# Altium project Smart Meter V1.0.PrjPcb (part 2 of 4)

## Sheet Controller Sheet.SchDoc
size 420 x 297 mm; SheetNumber: 2; SheetTotal: 6
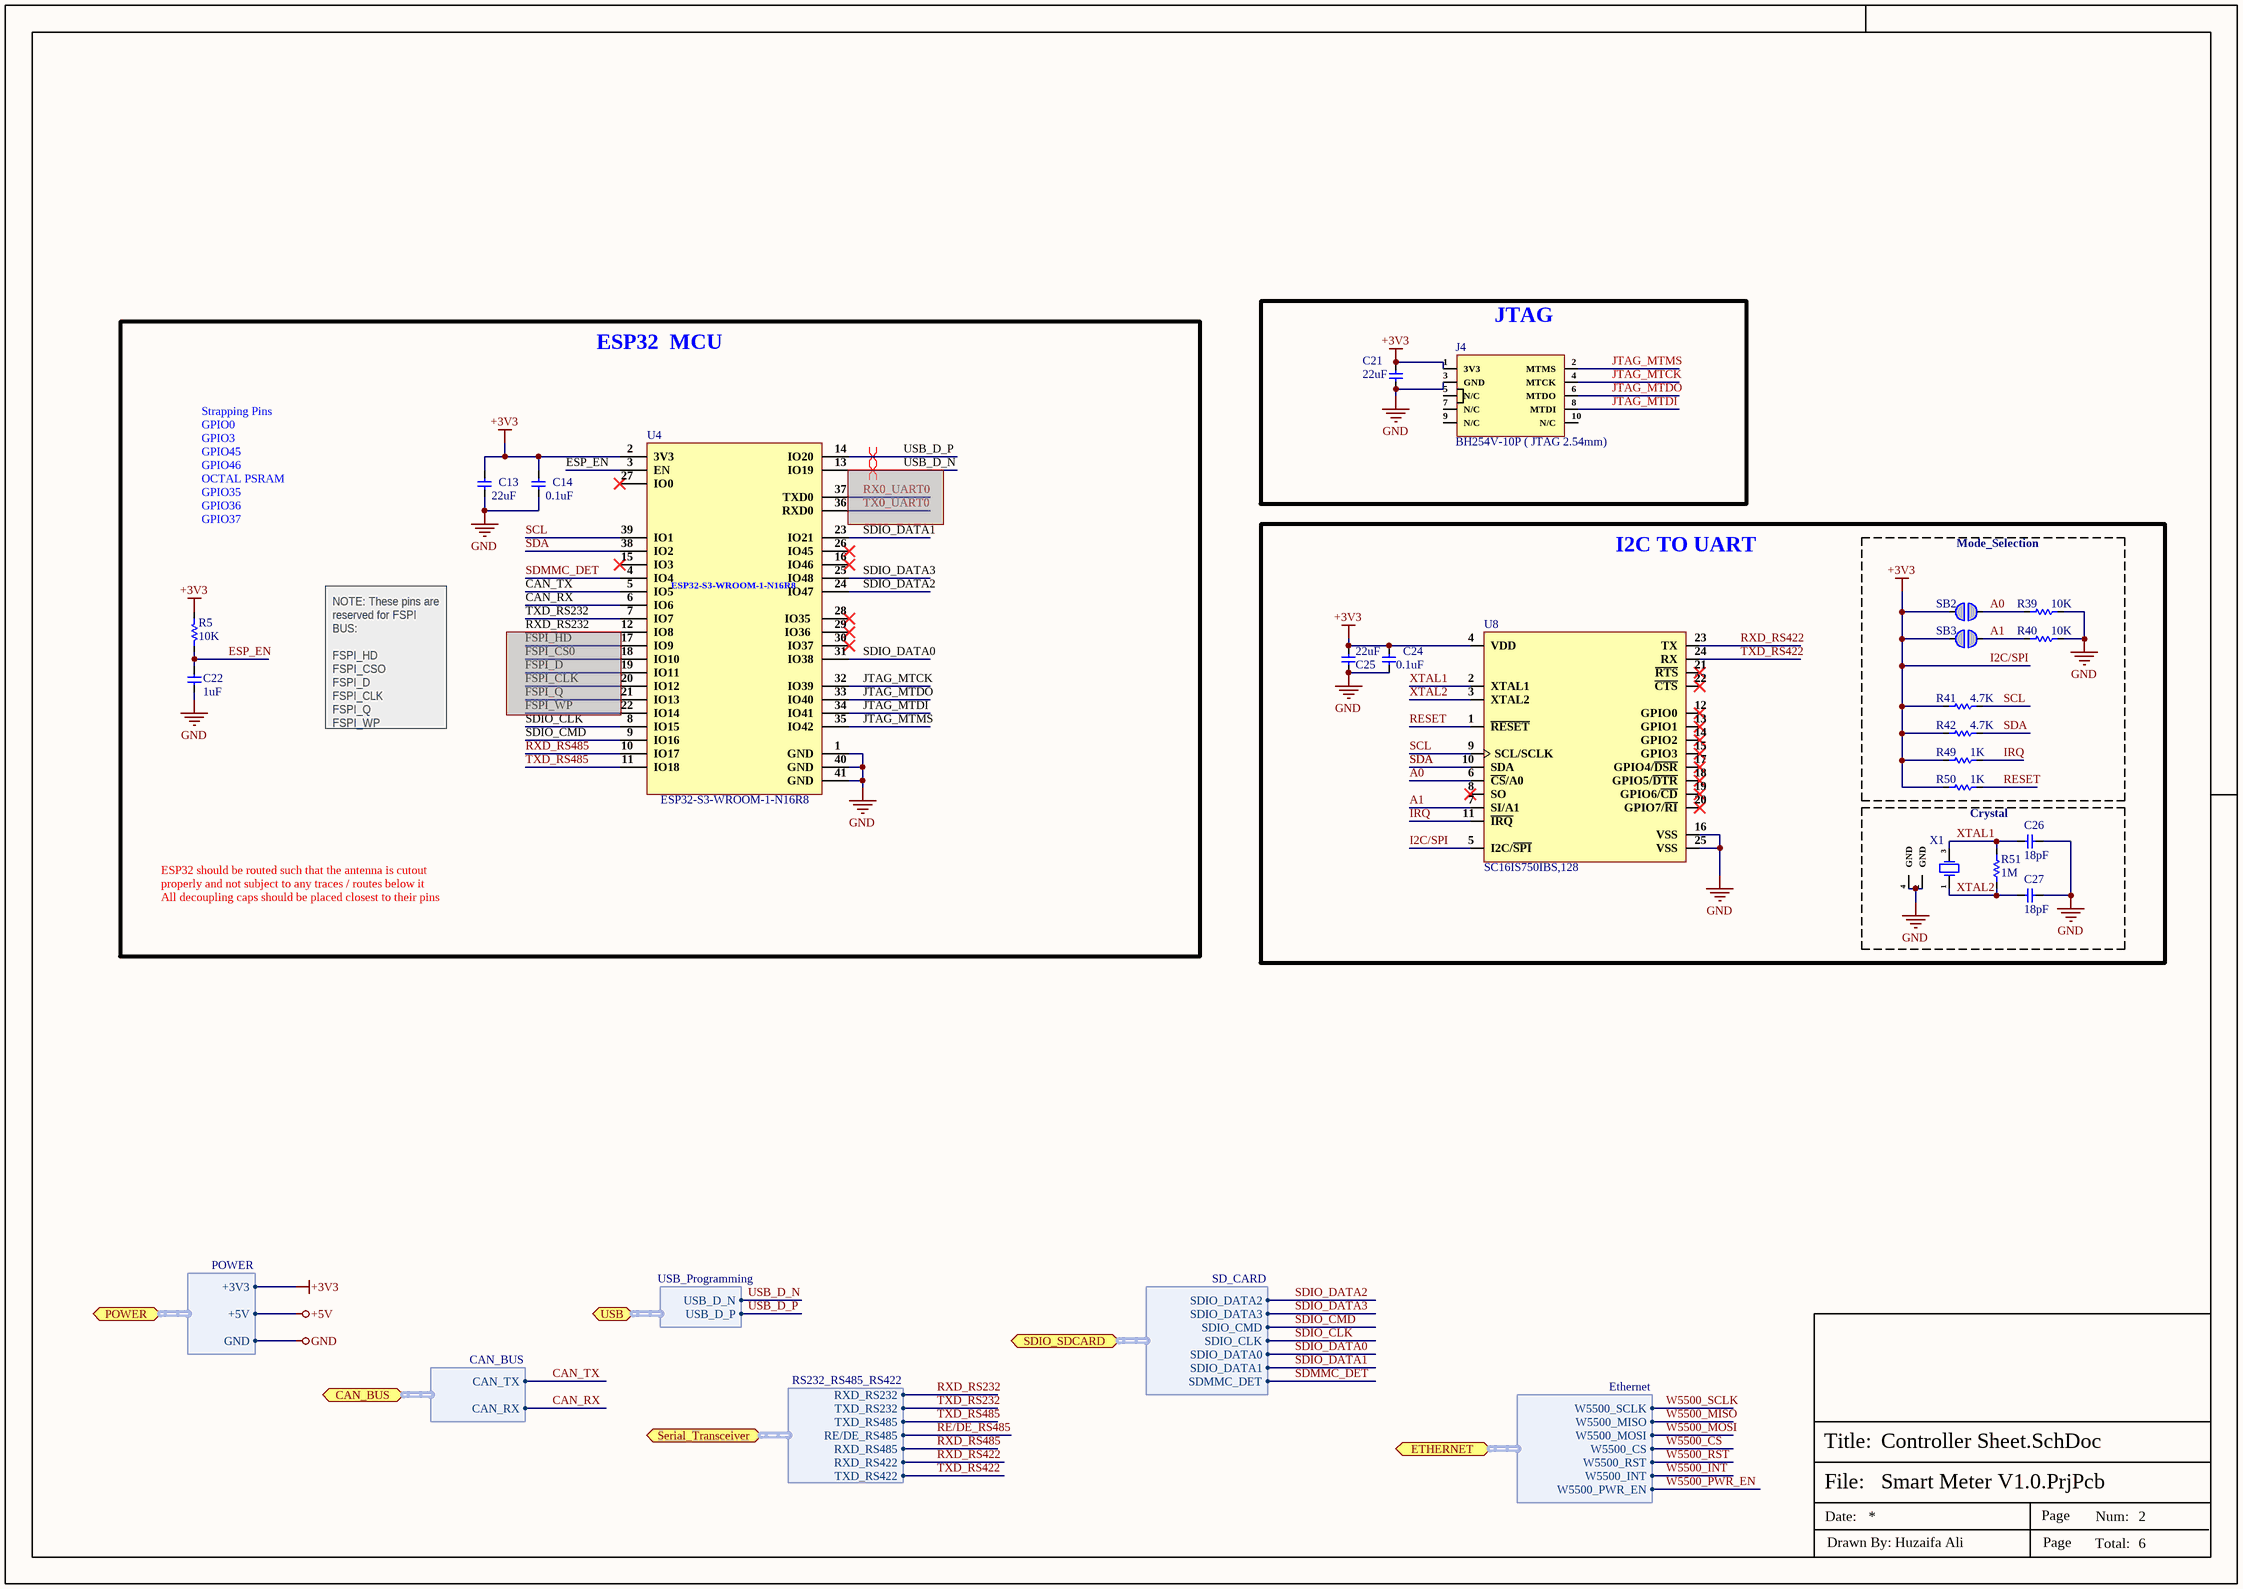
[diagram p1: Controller Sheet.SchDoc]

### Parts
(Parts that share a designator on the sheet are numbered #1, #2 ... from top to bottom, then left to right.)
C13  22uF  [Cap-0603]
C14  0.1uF  [Cap-0402]
C21#1  22uF  [Cap-0603]
C22  1uF  [Cap-0402]
C24  0.1uF  [Cap-0402]
C25#1  22uF  [Cap-0603]
C26  18pF  [Cap-0603]
C27  18pF  [Cap-0603]
J4#1  BH254V-10P ( JTAG 2.54mm)  [BH254V-10P]
R5  10K  [Res-0402]
R39#1  10K  [Res-0603]
R40#1  10K  [Res-0603]
R41#1  4.7K  [Res-0603]
R42#1  4.7K  [Res-0603]
R49  1K  [Res-1206]
R50  1K  [Res-1206]
R51  1M  [Res-0603]
SB2  Solder Bridge 0603  [Solder Bridge]  (value not drawn)  (no BOM)
SB3  Solder Bridge 0603  [Solder Bridge]  (value not drawn)  (no BOM)
U4  ESP32-S3-WROOM-1-N16R8  [41-SMD Module]
U8  SC16IS750IBS,128  [HVQFN-24-EP(4x4)]
X1#1  14.7456MHz  [SMD3225-4P]  (value not drawn)

### Blocks framed on the sheet
JTAG: C21#1 J4#1
ESP32  MCU: C13 C14 C22 R5 U4
I2C TO UART: C24 C25#1 U8
Mode_Selection: R39#1 R40#1 R41#1 R42#1 R49 R50 SB2 SB3
Crystal: C26 C27 R51 X1#1

### Ports
CAN_BUS (bidir, harness CAN_BUS), ETHERNET (bidir, harness Ethernet), POWER (bidir, harness POWER), SDIO_SDCARD (bidir, harness SD_CARD), Serial_Transceiver (bidir, harness RS232_RS485_RS422), USB (bidir, harness USB_Programming)

### Harnesses
SD_CARD: SDIO_DATA2, SDIO_DATA3, SDIO_CMD, SDIO_CLK, SDIO_DATA0, SDIO_DATA1, SDMMC_DET
Ethernet: W5500_SCLK, W5500_MISO, W5500_MOSI, W5500_CS, W5500_RST, W5500_INT, W5500_PWR_EN
CAN_BUS: CAN_TX, CAN_RX
POWER: +3V3, +5V, GND
USB_Programming: USB_D_N, USB_D_P
RS232_RS485_RS422: RXD_RS232, TXD_RS232, TXD_RS485, RE/DE_RS485, RXD_RS485, RXD_RS422, TXD_RS422

### Nets
CAN_RX: U4.6(IO6) ; port CAN_BUS.CAN_RX
CAN_TX: U4.5(IO5) ; port CAN_BUS.CAN_TX
GND: C13.1 C14.1 C21#1.1 C22.1 C24.1 C25#1.1 C26.2 C27.2 J4#1.3(GND) R39#1.2 R40#1.2 U4.1(GND) U4.40(GND) U4.41(GND) U8.16(VSS) U8.25(VSS) X1#1.2(GND) X1#1.4(GND) ; port POWER.GND
I2C/SPI: C13.2 C14.2 C21#1.2 C24.2 C25#1.2 J4#1.1(3V3) R5.2 R41#1.1 R42#1.1 R49.1 R50.1 SB2.2 SB3.2 U4.2(3V3) U8.4(VDD) U8.5(I2C/~{SPI}) ; port POWER.+3V3  [also labelled +3V3]
A0: R39#1.1 SB2.1 U8.6(~{CS}/A0)
A1: R40#1.1 SB3.1 U8.7(SI/A1)
ESP_EN: C22.2 R5.1 U4.3(EN)
IRQ: R49.2 U8.11(~{IRQ})
JTAG_MTCK: J4#1.4(MTCK) U4.32(IO39)
JTAG_MTDI: J4#1.8(MTDI) U4.34(IO41)
JTAG_MTDO: J4#1.6(MTDO) U4.33(IO40)
JTAG_MTMS: J4#1.2(MTMS) U4.35(IO42)
RESET: R50.2 U8.1(~{RESET})
RXD_RS422: U8.23(TX) ; port Serial_Transceiver.RXD_RS422
RXD_RS485: U4.10(IO17) ; port Serial_Transceiver.RXD_RS485
SCL: R41#1.2 U4.39(IO1) U8.9(SCL/SCLK)
SDA: R42#1.2 U4.38(IO2) U8.10(SDA)
SDIO_CLK: U4.8(IO15) ; port SDIO_SDCARD.SDIO_CLK
SDIO_CMD: U4.9(IO16) ; port SDIO_SDCARD.SDIO_CMD
SDIO_DATA0: U4.31(IO38) ; port SDIO_SDCARD.SDIO_DATA0
SDIO_DATA1: U4.23(IO21) ; port SDIO_SDCARD.SDIO_DATA1
SDIO_DATA2: U4.24(IO47) ; port SDIO_SDCARD.SDIO_DATA2
SDIO_DATA3: U4.25(IO48) ; port SDIO_SDCARD.SDIO_DATA3
SDMMC_DET: U4.4(IO4) ; port SDIO_SDCARD.SDMMC_DET
TXD_RS232: U4.7(IO7) ; port Serial_Transceiver.TXD_RS232
TXD_RS422: U8.24(RX) ; port Serial_Transceiver.TXD_RS422
TXD_RS485: U4.11(IO18) ; port Serial_Transceiver.TXD_RS485
USB_D_P: U4.14(IO20) ; port USB.USB_D_P
W5500_CS: port ETHERNET.W5500_CS
W5500_INT: port ETHERNET.W5500_INT
W5500_MISO: port ETHERNET.W5500_MISO
W5500_MOSI: port ETHERNET.W5500_MOSI
W5500_PWR_EN: port ETHERNET.W5500_PWR_EN
W5500_RST: port ETHERNET.W5500_RST
W5500_SCLK: port ETHERNET.W5500_SCLK
XTAL1: C26.1 R51.2 U8.2(XTAL1) X1#1.3(OSC2)
XTAL2: C27.1 R51.1 U8.3(XTAL2) X1#1.1(OSC1)

Not connected (* = marked no-connect by the designer): J4#1 5(N/C) 7(N/C) 9(N/C) 10(N/C); U4 12(IO8) 13(IO19) 15(IO3)* 16(IO46)* 17(IO9) 18(IO10) 19(IO11) 20(IO12) 21(IO13) 22(IO14) 26(IO45)* 27(IO0)* 28(IO35_)* 29(IO36_)* 30(IO37)* 36(RXD0) 37(TXD0); U8 8(SO)* 12(GPIO0)* 13(GPIO1)* 14(GPIO2)* 15(GPIO3)* 17(GPIO4/~{DSR})* 18(GPIO5/~{DTR})* 19(GPIO6/~{CD})* 20(GPIO7/~{RI})* 21(~{RTS})* 22(~{CTS})*

### Layout directives
differential pair; net class USB; differential pair class USB_Lines; rule Impedance Constraint [Min = 87.00    Max = 92.00    ]; rule Matched Net Lengths [Tolerance = 0.508mm]: NetU4_13, USB_D_P

### Notes on the sheet
- Strapping Pins
  GPIO0
  GPIO3
  GPIO45
  GPIO46
  OCTAL PSRAM
  GPIO35
  GPIO36
  GPIO37
- FSPI_HD
- FSPI_CS0
- FSPI_D
- NOTE: These pins are reserved for FSPI BUS:
  FSPI_HD
  FSPI_CSO
  FSPI_D
  FSPI_CLK
  FSPI_Q
  FSPI_WP
- FSPI_CLK
- FSPI_Q
- FSPI_WP
- ESP32 should be routed such that the antenna is cutout properly and not subject to any traces / routes below it
- All decoupling caps should be placed closest to their pins
- File:
- Title:
- Date:
- Page
- Num:
- Total:
- Drawn By: Huzaifa Ali

### Library data of the parts
C13 C21#1 C25#1 = CC0603MRX5R6BB226: CAP CER 22UF 10V X5R 0603; Manufacturer: Yageo; Tolerance: 20%; Item Type: Capacitor; Supplier 1: Digi-Key; Manufacturer Part Number: CC0603MRX5R6BB226; RoHS: Yes; Category: Ceramic Capacitors; Stock 1: 19628; Pricing 1: 1=0.68000, 10=0.48000, 50=0.36300, 100=0.31610, 500=0.23416, 1000=0.19903 (USD); Mount: Surface Mount; Case/Package: 0603; Case Code (Metric): 1608; Case Code (Imperial): 0603; Weight: 7.1E-05oz; Min Operating Temperature: -55°C; Max Operating Temperature: 85°C; Packaging: Tape and Reel; Capacitance: 22uF; Voltage Rating: 10V; Dielectric: X5R; Termination: SMD/SMT; Voltage Rating (DC): 10V; Package Quantity: 4000; Length: 0.063inch; Width: 0.8mm; Height: 0.8mm; Thickness: 0.035inch; Lead Free: Lead Free; Halogen Free: Halogen Free; RoHS Compliant: Yes; ComponentLink1URL: http://www.mouser.com/ds/2/447/Yageo_UPY-GP_NP0_16V-to-50V_9-358835.pdf?src-supplier=Mouser; ComponentLink1Description: http://www.mouser.com/ds/2/447/Yageo_UPY-GP_NP0_16V-to-50V_9-358835.pdf?src-supplier=Mouser; ComponentLink2URL: http://www.yageo.com/documents/recent/UPY-GPHC_X5R_4V-to-50V_25.pdf?src-supplier=Digi-Key; ComponentLink2Description: http://www.yageo.com/documents/recent/UPY-GPHC_X5R_4V-to-50V_25.pdf?src-supplier=Digi-Key; Supplier Part Number 1: 311-1819-1-ND; LCSC Part Number: C109447
C14 C24 = C1005X5R1H104K050BB: CAP CER 0.1UF 50V X5R 0402; Manufacturer: TDK; Dielectric Material: Ceramic; Capacitance: 100nF; Tolerance: 10%; Supplier 1: Digi-Key; Manufacturer Part Number: C1005X5R1H104K050BB; Stock 1: 1455182; Pricing 1: 1=0.12, 10=0.09, 50=0.049, 100=0.04, 500=0.02858, 1000=0.02245, 2500=0.02041, 5000=0.01878 (USD); Mount: Surface Mount; Case/Package: 0402; Case Code (Metric): 1005; Case Code (Imperial): 0402; Weight: 2.3E-05oz; Min Operating Temperature: -55°C; Max Operating Temperature: 85°C; Dielectric: X5R; Voltage Rating: 50V; Packaging: Tape and Reel; Voltage Rating (DC): 50V; Termination: SMD/SMT; Construction: Flat; Package Quantity: 1; Resistor Type: Ceramic; Voltage: 50V; Series: C; Length: 1mm; Width: 0.02inch; Height: 0.5mm; Depth: 0.5mm; Thickness: 0.022inch; Radiation Hardening: No; Lead Free: Lead Free; REACH SVHC: No SVHC; RoHS Compliant: Yes; ComponentLink1URL: https://product.tdk.com/info/en/catalog/spec/mlccspec_commercial_general_midvoltage_en.pdf?src-supplier=Digi-Key; ComponentLink1Description: https://product.tdk.com/info/en/catalog/spec/mlccspec_commercial_general_midvoltage_en.pdf?src-supplier=Digi-Key; ComponentLink2URL: http://www.tdk.co.jp/tefe02/e413_c.pdf?src-supplier=Future+Electronics; ComponentLink2Description: http://www.tdk.co.jp/tefe02/e413_c.pdf?src-supplier=Future+Electronics; ComponentLink3URL: https://www.verical.com/server-webapp/html/getDatasheet?partID=743571&src-supplier=Verical; ComponentLink3Description: https://www.verical.com/server-webapp/html/getDatasheet?partID=743571&src-supplier=Verical; ComponentLink4URL: http://www.tdk.co.jp/tefe02/e412_c.pdf?src-supplier=Avnet+Europe; ComponentLink4Description: http://www.tdk.co.jp/tefe02/e412_c.pdf?src-supplier=Avnet+Europe; Supplier Part Number 1: 445-5942-1-ND; LCSC Part Number: C2181865
C22 = CC0402KRX5R6BB105: CAP CER 1UF 10V X5R 0402; Manufacturer: Yageo; Tolerance: 10%; Dissipation Factor: 15%; Supplier 1: Mouser; Manufacturer Part Number: CC0402KRX5R6BB105; RoHS: Yes; Category: Ceramic Capacitors; Stock 1: 6711367; Pricing 1: 1=0.11000, 10=0.05500, 50=0.05500, 100=0.03300, 500=0.02700, 1000=0.02200, 2500=0.02100, 10000=0.01800 (USD); Mount: Surface Mount; Case/Package: 0402; Number of Pins: 2; Case Code (Metric): 1005; Case Code (Imperial): 0402; Min Operating Temperature: -55°C; Max Operating Temperature: 85°C; Capacitance: 1uF; Dielectric: X5R; Package Quantity: 1; Voltage Rating: 10V; Packaging: Tape and Reel; Voltage Rating (DC): 10V; Termination: SMD/SMT; Resistor Type: Ceramic; Series: CC; Construction: Flat; Length: 1mm; Width: 0.02inch; Height: 0.5mm; Thickness: 0.022inch; Depth: 0.5mm; Radiation Hardening: No; REACH SVHC: No SVHC; Lead Free: Lead Free; Halogen Free: Halogen Free; RoHS Compliant: Yes; ComponentLink1URL: https://datasheet.ciiva.com/176/upy-gphc-x5r-4v-to-50v-12-176704.pdf?src-supplier=Digi-Key; ComponentLink1Description: https://datasheet.ciiva.com/176/upy-gphc-x5r-4v-to-50v-12-176704.pdf?src-supplier=Digi-Key; ComponentLink2URL: https://datasheet.ciiva.com/176/mlccorderingcode-176705.pdf?src-supplier=Digi-Key; ComponentLink2Description: https://datasheet.ciiva.com/176/mlccorderingcode-176705.pdf?src-supplier=Digi-Key; ComponentLink3URL: https://datasheet.ciiva.com/176/mlccorderingcode-176706.pdf?src-supplier=Digi-Key; ComponentLink3Description: https://datasheet.ciiva.com/176/mlccorderingcode-176706.pdf?src-supplier=Digi-Key; Supplier Part Number 1: 603-CC402KRX5R6BB105; LCSC Part Number: C106254
C26 C27 = CL10C180JB8NNNC: CAP CER 18PF 50V C0G/NP0 0603; Manufacturer: Samsung; Material: Ceramic; Tolerance: 5%; Dielectric: C0G; Temperature Coefficient: 300ppm/°C; Supplier 1: Arrow Electronics; Manufacturer Part Number: CL10C180JB8NNNC; RoHS: Yes; Category: Ceramic Capacitors; Stock 1: 1828000; Pricing 1: 4000=0.00360, 8000=0.00210 (USD); Mount: Surface Mount; Case/Package: 0603; Case Code (Metric): 1608; Case Code (Imperial): 0603; Contact Plating: Tin; Min Operating Temperature: -55°C; Max Operating Temperature: 125°C; Capacitance: 18pF; Voltage: 50V; Packaging: Tape and Reel; Voltage Rating: 50V; Series: CL; Construction: Flat; Length: 1.6mm; Width: 0.031inch; Height: 0.8mm; Depth: 0.8mm; Thickness: 0.035inch; Radiation Hardening: No; RoHS Compliant: Yes; ComponentLink1URL: https://datasheet.ciiva.com/25709/cl10c180jb8nnnc-25709670.pdf?src-supplier=Digi-Key; ComponentLink1Description: https://datasheet.ciiva.com/25709/cl10c180jb8nnnc-25709670.pdf?src-supplier=Digi-Key; ComponentLink2URL: https://datasheet.ciiva.com/26838/getdatasheetpartid-660083-26838496.pdf?src-supplier=Verical; ComponentLink2Description: https://datasheet.ciiva.com/26838/getdatasheetpartid-660083-26838496.pdf?src-supplier=Verical; ComponentLink3URL: https://datasheet.ciiva.com/29198/457219-da-01-en-vs-kondensator-0603-29198763.pdf?src-supplier=Conrad; ComponentLink3Description: https://datasheet.ciiva.com/29198/457219-da-01-en-vs-kondensator-0603-29198763.pdf?src-supplier=Conrad; ComponentLink4URL: https://datasheet.ciiva.com/26310/mlcc-catalogdownload2013-eng-26310310.pdf?src-supplier=Distrelec; ComponentLink4Description: https://datasheet.ciiva.com/26310/mlcc-catalogdownload2013-eng-26310310.pdf?src-supplier=Distrelec; Supplier Part Number 1: CL10C180JB8NNNC
J4#1 = BH254V-10P ( JTAG 2.54mm): 2.54mm -40℃~+105℃ Straight 3A 250V 5 Push - Pull 2.54mm 2 Plugin,P=2.54mm IDC Connectors ROHS; Manufacturer: XFCN; Manufacturer Part Number: BH254V-10P; Package: Plugin,P=2.54mm; LCSC Part Number: C492442; Item Type: Connector; ComponentLink1Description: LCSC; ComponentLink1URL: https://www.lcsc.com/product-detail/IDC-Connectors_XFCN-BH254V-10P_C492442.html
R5 = RC0402FR-0710KL: RES 10K OHM 1% 1/16W 0402; Manufacturer: Yageo; Resistance: 10kR; Voltage Rating (DC): 50V; Temperature Coefficient: 100ppm/°C; Power Rating: 62.5mW; Max Power Dissipation: 63mW; Item Type: Resistor; Supplier 1: Mouser; Manufacturer Part Number: RC0402FR-0710KL; RoHS: Yes; Category: Chip SMD Resistors; Stock 1: 18648329; Pricing 1: 1=0.10000, 10=0.01400, 50=0.01400, 100=0.00500, 1000=0.00300, 10000=0.00200 (USD); Case/Package: 0402; Number of Pins: 2; Case Code (Imperial): 0402; Case Code (Metric): 1005; Min Operating Temperature: -55°C; Max Operating Temperature: 155°C; Resistor Type: Thick Film; Tolerance: 1%; Packaging: Tape and Reel; Voltage Rating: 50V; Termination: SMD/SMT; Working Voltage: 50V; Number of Terminations: 2; Features: Moisture Resistant; Series: RC; Resistance Tolerance: 1%; Construction: Rectangular; Length: 1mm; Width: 0.5mm; Height: 0.32mm; Depth: 0.5mm; Lead Pitch: 0.2mm; REACH SVHC: No SVHC; Lead Free: Lead Free; RoHS Compliant: Yes; Military Standard: Not; ComponentLink1URL: https://datasheet.ciiva.com/7660/38568-7660787.pdf?src-supplier=Element14; ComponentLink1Description: https://datasheet.ciiva.com/7660/38568-7660787.pdf?src-supplier=Element14; ComponentLink2URL: https://datasheet.ciiva.com/7849/1686128-7849814.pdf?src-supplier=Element14; ComponentLink2Description: https://datasheet.ciiva.com/7849/1686128-7849814.pdf?src-supplier=Element14; ComponentLink3URL: https://datasheet.ciiva.com/7983/1018594-7983486.pdf?src-supplier=Element14; ComponentLink3Description: https://datasheet.ciiva.com/7983/1018594-7983486.pdf?src-supplier=Element14; ComponentLink4URL: https://datasheet.ciiva.com/22747/1018594-22747512.pdf?src-supplier=Element14; ComponentLink4Description: https://datasheet.ciiva.com/22747/1018594-22747512.pdf?src-supplier=Element14; ComponentLink5URL: https://datasheet.ciiva.com/12667/pyu-rc0402-51-rohs-l-6-r-12667067.pdf?src-supplier=Mouser; ComponentLink5Description: https://datasheet.ciiva.com/12667/pyu-rc0402-51-rohs-l-6-r-12667067.pdf?src-supplier=Mouser; ComponentLink6URL: https://datasheet.ciiva.com/7849/1784430-7849813.pdf?src-supplier=Element14; ComponentLink6Description: https://datasheet.ciiva.com/7849/1784430-7849813.pdf?src-supplier=Element14; ComponentLink7URL: https://datasheet.ciiva.com/7849/1784430-7849815.pdf?src-supplier=Element14; ComponentLink7Description: https://datasheet.ciiva.com/7849/1784430-7849815.pdf?src-supplier=Element14; Supplier Part Number 1: 603-RC0402FR-0710KL; LCSC Part Number: C60490
R39#1 R40#1 = RK73G1JTTD1002F: RES 10K OHM 1% 1/10W 0603; Item Type: Resistor; Value: 10kR; Power Rating: 100mW; Voltage Rating: 75V; Temperature Coefficient: 50ppm/°C; LCSC Part Number: C362180; ComponentLink1Description: LCSC; Supplier: Digi-Key; Supplier Part Number: 2019-RK73G1JTTD1002FCT-ND; RoHS: Yes; Category: Chip SMD Resistors; Stock: 249394; Pricing: 1=0.22, 10=0.118, 50=0.0812, 100=0.0699, 500=0.0513, 1000=0.04545 (USD); Case/Package: 0603; Case Code (Imperial): 0603; Case Code (Metric): 1608; Min Operating Temperature: -55°C; Max Operating Temperature: 125°C; Tolerance: 1%; Packaging: Tape and Reel; Termination: SMD/SMT; Series: RK73G; Construction: Rectangular; Length: 1.6mm; Depth: 0.8mm; Military Standard: Not; RoHS Compliant: Yes; ComponentLink2URL: http://www.mouser.com/ds/2/219/RK73G-9863.pdf?src-supplier=Mouser; ComponentLink2Description: http://www.mouser.com/ds/2/219/RK73G-9863.pdf?src-supplier=Mouser
R41#1 R42#1 = RC0603FR-074K7L: RES SMD 4.7K OHM 1% 1/10W 0603; Manufacturer: Yageo; Item Type: Resistor; Manufacturer Part Number: RC0603FR-074K7L; Package: 0603; ComponentLink7Description: LCSC; ComponentLink7URL: https://www.lcsc.com/product-detail/Chip-Resistor-Surface-Mount_YAGEO-RC0603FR-074K7L_C99782.html; LCSC Part Number: C99782
R49 R50 = RC1206FR-7W1KL: RES 1K OHM 1% 1/2W 1206; Manufacturer: Yageo; Item Type: Resistor; Supplier 1: Digi-Key; Manufacturer Part Number: RC1206FR-7W1KL; RoHS: Yes; Category: Chip SMD Resistors; Stock 1: 6215; Pricing 1: 1=0.19000, 10=0.15700, 100=0.06150, 1000=0.02572, 2500=0.02358 (USD); RoHS Compliant: Yes; Supplier Part Number 1: 13-RC1206FR-7W1KLCT-ND; LCSC Part Number: C859155; ComponentLink1Description: LCSC; ComponentLink1URL: https://www.lcsc.com/product-detail/Chip-Resistor-Surface-Mount_YAGEO-RC1206FR-7W1KL_C859155.html
R51 = RC0603FR-071ML: RES SMD 1M OHM 1% 1/10W 0603; Manufacturer: Yageo; Voltage Rating: 50V; Resistance: 1MR; Power Rating: 100mW; Temperature Coefficient: 100ppm/°C; Item Type: Resistor; Supplier 1: Digi-Key; Manufacturer Part Number: RC0603FR-071ML; Stock 1: 3824601; Pricing 1: 1=0.1, 10=0.023, 100=0.0094, 1000=0.00421, 2500=0.00366 (USD); Case/Package: 0603; Number of Pins: 2; Case Code (Imperial): 0603; Case Code (Metric): 1608; Min Operating Temperature: -55°C; Max Operating Temperature: 155°C; Voltage Rating (DC): 50V; Tolerance: 1%; Packaging: Tape and Reel; Package Quantity: 5000; Termination: SMD/SMT; Composition: Thick Film; Military Standard: Not; Length: 1.6mm; Height: 0.45mm; Width: 0.8mm; Depth: 0.8mm; REACH SVHC: No SVHC; Lead Free: Lead Free; ComponentLink1URL: http://www.farnell.com/datasheets/2167052.pdf?src-supplier=Mouser; ComponentLink1Description: http://www.farnell.com/datasheets/2167052.pdf?src-supplier=Mouser; ComponentLink2URL: http://www.farnell.com/datasheets/2167052.pdf?src-supplier=Element14; ComponentLink2Description: http://www.farnell.com/datasheets/2167052.pdf?src-supplier=Element14; ComponentLink3URL: http://documents.rs-components.com/techlib://itc_doclist_GB.htm?stockno=5048956&src-supplier=RSComponents; ComponentLink3Description: http://documents.rs-components.com/techlib://itc_doclist_GB.htm?stockno=5048956&src-supplier=RSComponents; Supplier Part Number 1: 311-1.00MHRDKR-ND; LCSC Part Number: C105578
SB2 SB3 = Solder Bridge 0603: Solder Bridge ON; Manufacturer Part Number: Solder Bridge; Item Type: Solder Bridge
U4 = ESP32-S3-WROOM-1-N16R8: SMD MODULE, ESP32-S3R8 WITH 3.3V; Manufacturer: Espressif Systems; Supplier 1: Digi-Key; Manufacturer Part Number: ESP32-S3-WROOM-1-N16R8; RoHS: No; Category: Uncategorized; Stock 1: 423; Pricing 1: 1=4.29000 (USD); Supplier Part Number 1: 1965-ESP32-S3-WROOM-1-N16R8CT-ND; LCSC Part Number: C2913202; Item Type: Module; ComponentLink1Description: LCSC; ComponentLink1URL: https://www.lcsc.com/product-detail/WiFi-Modules_Espressif-Systems-ESP32-S3-WROOM-1-N16R8_C2913202.html
U8 = SC16IS750IBS,128: IC UART I2C/SPI 24-HVQFN; Manufacturer: NXP Semiconductors; Interface: 39,40,1519,1532Interface; Supplier: Future Electronics; LCSC Part Number: C2651891; Manufacturer Part Number: SC16IS750IBS,128; RoHS: Yes; Item Type: IC; Stock: 1500; Pricing: 1500=1.65 (USD); Contact Plating: 157ConductorMaterial; Height: 1mm; Lead Free: 5697LeadFree; ComponentLink1URL: https://datasheet.ciiva.com/15150/getdatasheetpartid-449890-15150365.pdf?src-supplier=Verical; ComponentLink1Description: https://datasheet.ciiva.com/15150/getdatasheetpartid-449890-15150365.pdf?src-supplier=Verical; ComponentLink2URL: https://datasheet.ciiva.com/1787/sc16is740-750-760-1787404.pdf?src-supplier=Digikey; ComponentLink2Description: https://datasheet.ciiva.com/1787/sc16is740-750-760-1787404.pdf?src-supplier=Digikey
X1#1 = ABM8AIG-14.7456MHZ-12-2Z-T3: CRYSTAL 14.7456MHZ 12PF SMD; Manufacturer: Abracon; Item Type: Crystals; Supplier: Mouser; LCSC Part Number: C5544758; Manufacturer Part Number: ABM8AIG-14.7456MHZ-12-2Z-T3; RoHS: Yes; Stock: 3296; Pricing: 1=0.74, 10=0.67, 50=0.67, 100=0.67, 1000=0.67, 10000=0.67 (USD); ComponentLink1URL: http://www.mouser.com/ds/2/3/ABM8AIG-783590.pdf?src-supplier=Mouser; ComponentLink1Description: http://www.mouser.com/ds/2/3/ABM8AIG-783590.pdf?src-supplier=Mouser; ComponentLink2URL: https://abracon.com/AIGcrystals/ABM8AIG.pdf?src-supplier=Digikey; ComponentLink2Description: https://abracon.com/AIGcrystals/ABM8AIG.pdf?src-supplier=Digikey